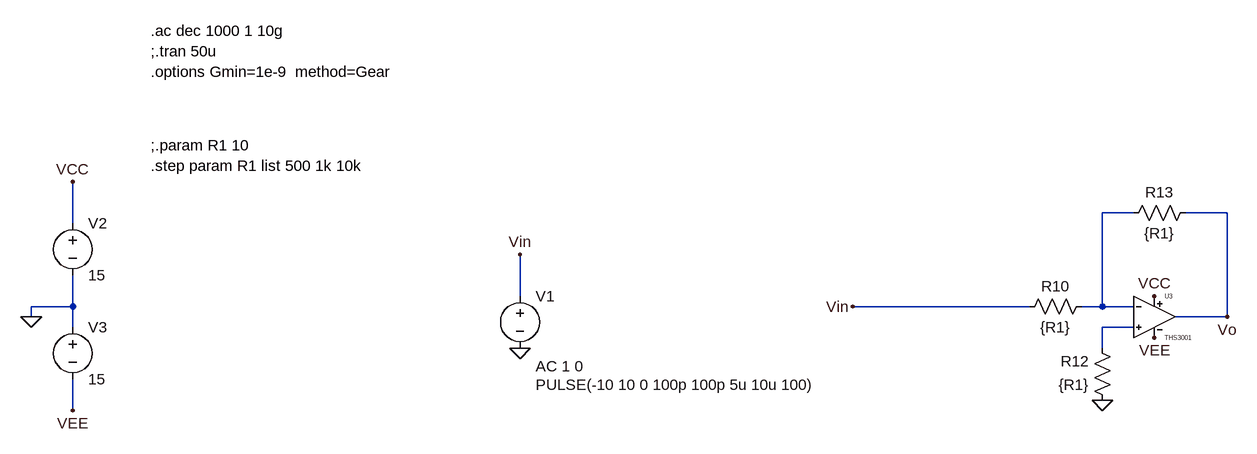
[diagram p0: schematic ths3001.asc]
ths3001.asc, the LTspice schematic file:
Version 4
SHEET 1 1296 1756
WIRE 304 144 256 144
WIRE 448 144 384 144
WIRE -1328 160 -1328 96
WIRE -640 272 -640 208
WIRE -1328 288 -1328 240
WIRE -1328 288 -1392 288
WIRE 144 288 -128 288
WIRE 256 288 256 144
WIRE 256 288 224 288
WIRE 304 288 256 288
WIRE -1392 304 -1392 288
WIRE 448 304 448 144
WIRE 448 304 368 304
WIRE -1328 320 -1328 288
WIRE 304 320 256 320
WIRE 256 352 256 320
WIRE -1328 448 -1328 400
FLAG -1392 304 0
FLAG -1328 96 VCC
FLAG -1328 448 VEE
FLAG 336 272 VCC
FLAG 336 336 VEE
FLAG -128 288 Vin
FLAG 256 432 0
FLAG 448 304 Vo
FLAG -640 352 0
FLAG -640 208 Vin
SYMBOL voltage -640 256 R0
WINDOW 3 24 152 Left 2
WINDOW 123 24 124 Left 2
WINDOW 39 0 0 Left 0
SYMATTR Value PULSE(-10 10 0 100p 100p 5u 10u 100)
SYMATTR Value2 AC 1 0
SYMATTR InstName V1
SYMBOL voltage -1328 144 R0
WINDOW 123 0 0 Left 0
WINDOW 39 0 0 Left 0
SYMATTR InstName V2
SYMATTR Value 15
SYMBOL voltage -1328 304 R0
WINDOW 123 0 0 Left 0
WINDOW 39 0 0 Left 0
SYMATTR InstName V3
SYMATTR Value 15
SYMBOL THS3001 336 240 R0
SYMATTR InstName U3
SYMBOL res 240 272 R90
WINDOW 0 0 56 VBottom 2
WINDOW 3 32 56 VTop 2
SYMATTR InstName R10
SYMATTR Value {R1}
SYMBOL res 272 448 R180
WINDOW 0 36 76 Left 2
WINDOW 3 36 40 Left 2
SYMATTR InstName R12
SYMATTR Value {R1}
SYMBOL res 288 160 R270
WINDOW 0 32 56 VTop 2
WINDOW 3 0 56 VBottom 2
SYMATTR InstName R13
SYMATTR Value {R1}
TEXT -1208 -136 Left 2 !.ac dec 1000 1 10g\n;.tran 50u\n.options Gmin=1e-9  method=Gear
TEXT -1208 40 Left 2 !;.param R1 10\n.step param R1 list 500 1k 10k

The netlist it stands for:
* ths3001.asc
V1 Vin 0 PULSE(-10 10 0 100p 100p 5u 10u 100) AC 1 0
V2 VCC 0 15
V3 0 VEE 15
XU3 N002 N001 VCC VEE Vo THS3001  ; pins IN+ IN- VCC VEE OUT
R10 N001 Vin {R1}
R12 0 N002 {R1}
R13 N001 Vo {R1}
.ac dec 1000 1 10g
;.tran 50u
.options Gmin=1e-9  method=Gear
;.param R1 10
.step param R1 list 500 1k 10k
.lib THS3001.lib
.backanno
.end